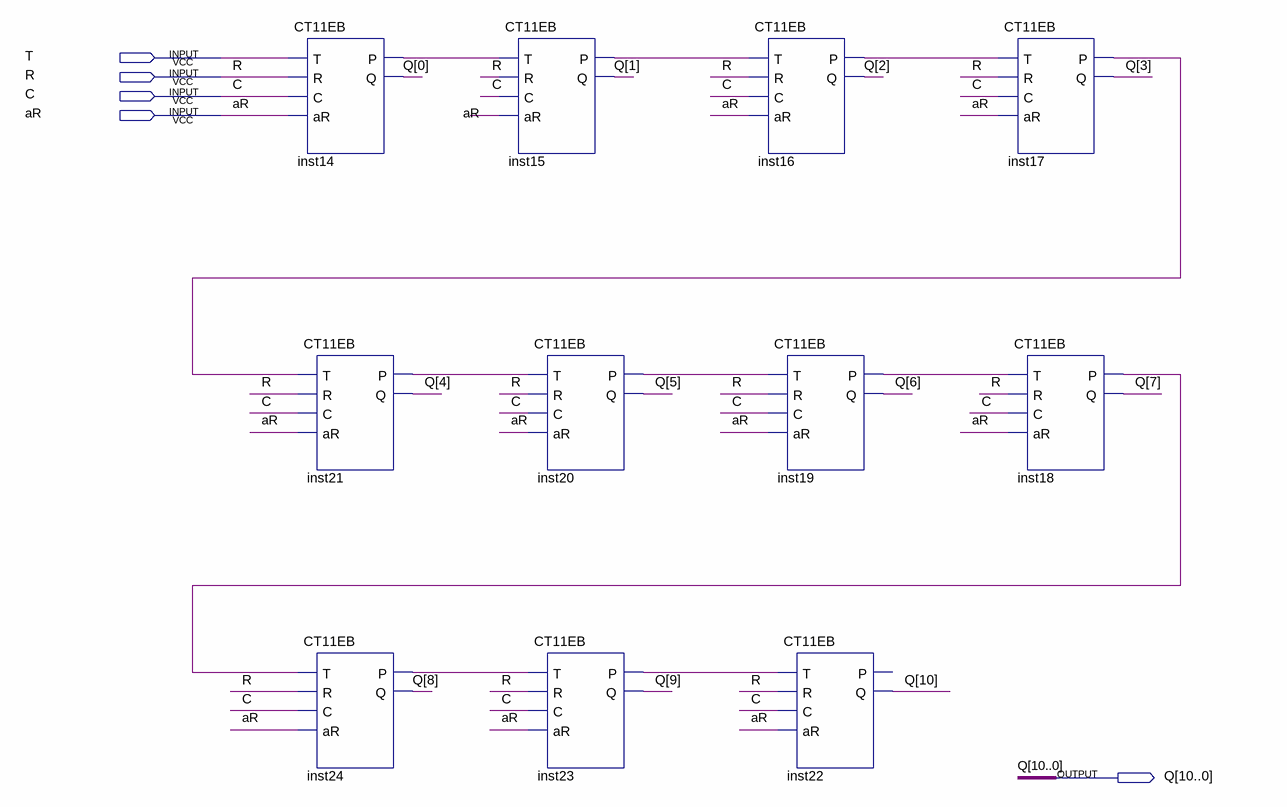
[diagram p0: schematic sheet]
// Quartus schematic TransCT11.bdf as structural Verilog: 11 symbols, 5 pins
module TransCT11 (
  input  T,
  input  R,
  input  C,
  input  aR,
  output [10:0] Q
);

  wire inst14_p, inst15_p, inst16_p, inst17_p, inst18_p, inst19_p, inst20_p, inst21_p, inst23_p, inst24_p;

  CT11EB inst14 (.T(T), .R(R), .C(C), .aR(aR), .P(inst14_p), .Q(Q[0]));
  CT11EB inst21 (.T(inst17_p), .R(R), .C(C), .aR(aR), .P(inst21_p), .Q(Q[4]));
  CT11EB inst24 (.T(inst18_p), .R(R), .C(C), .aR(aR), .P(inst24_p), .Q(Q[8]));
  CT11EB inst15 (.T(inst14_p), .R(R), .C(C), .aR(aR), .P(inst15_p), .Q(Q[1]));
  CT11EB inst20 (.T(inst21_p), .R(R), .C(C), .aR(aR), .P(inst20_p), .Q(Q[5]));
  CT11EB inst23 (.T(inst24_p), .R(R), .C(C), .aR(aR), .P(inst23_p), .Q(Q[9]));
  CT11EB inst16 (.T(inst15_p), .R(R), .C(C), .aR(aR), .P(inst16_p), .Q(Q[2]));
  CT11EB inst19 (.T(inst20_p), .R(R), .C(C), .aR(aR), .P(inst19_p), .Q(Q[6]));
  CT11EB inst22 (.T(inst23_p), .R(R), .C(C), .aR(aR), .Q(Q[10]));  // open: P
  CT11EB inst17 (.T(inst16_p), .R(R), .C(C), .aR(aR), .P(inst17_p), .Q(Q[3]));
  CT11EB inst18 (.T(inst19_p), .R(R), .C(C), .aR(aR), .P(inst18_p), .Q(Q[7]));
endmodule
